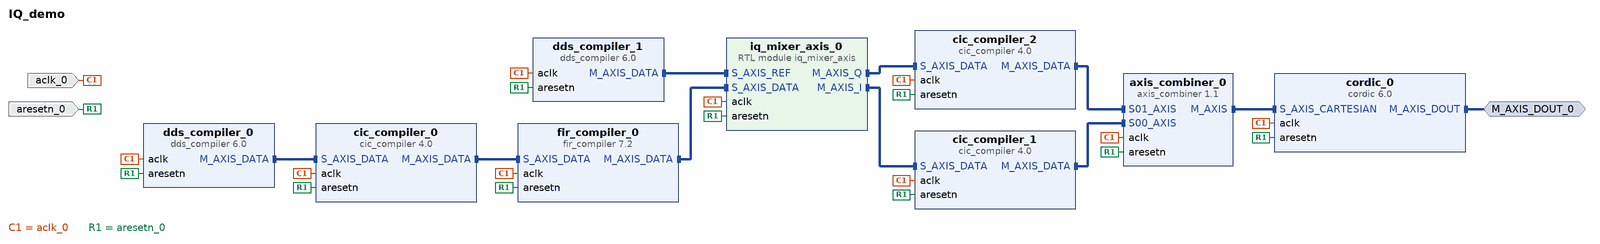
[diagram p0: block diagram of the top level]
# Vivado block design IQ_demo, xc7z010clg400-1, Vivado 2021.2
create_bd_design IQ_demo

create_bd_intf_port -mode Master -vlnv xilinx.com:interface:axis_rtl:1.0 M_AXIS_DOUT_0
set_property -dict {CONFIG.FREQ_HZ 125000000} [get_bd_intf_ports M_AXIS_DOUT_0]
create_bd_port -dir I -type clk aclk_0
set_property -dict {CONFIG.FREQ_HZ 125000000} [get_bd_ports aclk_0]
create_bd_port -dir I -type rst aresetn_0

create_bd_cell -type ip -vlnv xilinx.com:ip:dds_compiler:6.0 dds_compiler_0
set_property -dict [list \
  CONFIG.DATA_Has_TLAST Not_Required \
  CONFIG.DDS_Clock_Rate 125 \
  CONFIG.Frequency_Resolution 0.4 \
  CONFIG.Has_ARESETn true \
  CONFIG.Has_Phase_Out false \
  CONFIG.Latency 9 \
  CONFIG.M_DATA_Has_TUSER Not_Required \
  CONFIG.Noise_Shaping Auto \
  CONFIG.Output_Frequency1 0.1 \
  CONFIG.Output_Selection Sine \
  CONFIG.Output_Width 14 \
  CONFIG.PINC1 1101000110110111000 \
  CONFIG.POFF1 1000000000000000000000000000 \
  CONFIG.Phase_Offset_Angles1 0.25 \
  CONFIG.Phase_Width 29 \
  CONFIG.Phase_offset Fixed \
  CONFIG.S_PHASE_Has_TUSER Not_Required \
  CONFIG.Spurious_Free_Dynamic_Range 84 \
] [get_bd_cells dds_compiler_0]
create_bd_cell -type ip -vlnv xilinx.com:ip:cic_compiler:4.0 cic_compiler_0
set_property -dict [list \
  CONFIG.Clock_Frequency 125 \
  CONFIG.Filter_Type Decimation \
  CONFIG.Fixed_Or_Initial_Rate 8 \
  CONFIG.HAS_ARESETN true \
  CONFIG.Input_Data_Width 14 \
  CONFIG.Input_Sample_Frequency 125 \
  CONFIG.Maximum_Rate 8 \
  CONFIG.Minimum_Rate 8 \
  CONFIG.Number_Of_Stages 6 \
  CONFIG.Output_Data_Width 16 \
  CONFIG.Quantization Truncation \
  CONFIG.SamplePeriod 1 \
] [get_bd_cells cic_compiler_0]
create_bd_cell -type ip -vlnv xilinx.com:ip:fir_compiler:7.2 fir_compiler_0
set_property -dict [list \
  CONFIG.BestPrecision true \
  CONFIG.Clock_Frequency 125 \
  CONFIG.CoefficientSource COE_File \
  CONFIG.Coefficient_File ../../../../../../rx_fir.coe \
  CONFIG.Coefficient_Fractional_Bits 24 \
  CONFIG.Coefficient_Sets 1 \
  CONFIG.Coefficient_Sign Signed \
  CONFIG.Coefficient_Structure Inferred \
  CONFIG.Coefficient_Width 24 \
  CONFIG.ColumnConfig 3 \
  CONFIG.Decimation_Rate 2 \
  CONFIG.Filter_Architecture Systolic_Multiply_Accumulate \
  CONFIG.Filter_Type Decimation \
  CONFIG.Has_ARESETn true \
  CONFIG.Interpolation_Rate 1 \
  CONFIG.Number_Channels 1 \
  CONFIG.Output_Rounding_Mode Convergent_Rounding_to_Even \
  CONFIG.Output_Width 18 \
  CONFIG.Quantization Quantize_Only \
  CONFIG.RateSpecification Frequency_Specification \
  CONFIG.Sample_Frequency 15.625 \
  CONFIG.Zero_Pack_Factor 1 \
] [get_bd_cells fir_compiler_0]
create_bd_cell -type ip -vlnv xilinx.com:ip:cic_compiler:4.0 cic_compiler_1
set_property -dict [list \
  CONFIG.Clock_Frequency 125 \
  CONFIG.Filter_Type Decimation \
  CONFIG.Fixed_Or_Initial_Rate 625 \
  CONFIG.HAS_ARESETN true \
  CONFIG.Input_Data_Width 17 \
  CONFIG.Input_Sample_Frequency 7.8125 \
  CONFIG.Maximum_Rate 625 \
  CONFIG.Minimum_Rate 625 \
  CONFIG.Output_Data_Width 24 \
  CONFIG.Quantization Truncation \
  CONFIG.SamplePeriod 1 \
] [get_bd_cells cic_compiler_1]
create_bd_cell -type ip -vlnv xilinx.com:ip:cordic:6.0 cordic_0
set_property -dict [list \
  CONFIG.ARESETN true \
  CONFIG.Compensation_Scaling Embedded_Multiplier \
  CONFIG.Data_Format SignedFraction \
  CONFIG.Functional_Selection Translate \
  CONFIG.Input_Width 24 \
  CONFIG.Output_Width 24 \
  CONFIG.Phase_Format Scaled_Radians \
] [get_bd_cells cordic_0]
create_bd_cell -type module -reference iq_mixer_axis iq_mixer_axis_0
create_bd_cell -type ip -vlnv xilinx.com:ip:dds_compiler:6.0 dds_compiler_1
set_property -dict [list \
  CONFIG.DDS_Clock_Rate 125 \
  CONFIG.Frequency_Resolution 0.4 \
  CONFIG.Has_ARESETn true \
  CONFIG.Has_Phase_Out false \
  CONFIG.Latency 8 \
  CONFIG.M_DATA_Has_TUSER Not_Required \
  CONFIG.Noise_Shaping Auto \
  CONFIG.Output_Frequency1 0.1 \
  CONFIG.Output_Width 16 \
  CONFIG.PINC1 1101000110110111000 \
  CONFIG.Phase_Width 29 \
  CONFIG.Spurious_Free_Dynamic_Range 96 \
] [get_bd_cells dds_compiler_1]
create_bd_cell -type ip -vlnv xilinx.com:ip:cic_compiler:4.0 cic_compiler_2
set_property -dict [list \
  CONFIG.Clock_Frequency 125 \
  CONFIG.Filter_Type Decimation \
  CONFIG.Fixed_Or_Initial_Rate 625 \
  CONFIG.HAS_ARESETN true \
  CONFIG.Input_Data_Width 17 \
  CONFIG.Input_Sample_Frequency 7.8125 \
  CONFIG.Maximum_Rate 625 \
  CONFIG.Minimum_Rate 625 \
  CONFIG.Output_Data_Width 24 \
  CONFIG.Quantization Truncation \
  CONFIG.SamplePeriod 1 \
] [get_bd_cells cic_compiler_2]
create_bd_cell -type ip -vlnv xilinx.com:ip:axis_combiner:1.1 axis_combiner_0
set_property -dict {CONFIG.TDATA_NUM_BYTES 3} [get_bd_cells axis_combiner_0]

# ---- connections ----

connect_bd_intf_net [get_bd_intf_pins axis_combiner_0/M_AXIS] [get_bd_intf_pins cordic_0/S_AXIS_CARTESIAN]
connect_bd_intf_net [get_bd_intf_pins cic_compiler_0/M_AXIS_DATA] [get_bd_intf_pins fir_compiler_0/S_AXIS_DATA]
connect_bd_intf_net [get_bd_intf_pins cic_compiler_1/M_AXIS_DATA] [get_bd_intf_pins axis_combiner_0/S00_AXIS]
connect_bd_intf_net [get_bd_intf_pins cic_compiler_2/M_AXIS_DATA] [get_bd_intf_pins axis_combiner_0/S01_AXIS]
connect_bd_intf_net [get_bd_intf_ports M_AXIS_DOUT_0] [get_bd_intf_pins cordic_0/M_AXIS_DOUT]
connect_bd_intf_net [get_bd_intf_pins dds_compiler_0/M_AXIS_DATA] [get_bd_intf_pins cic_compiler_0/S_AXIS_DATA]
connect_bd_intf_net [get_bd_intf_pins dds_compiler_1/M_AXIS_DATA] [get_bd_intf_pins iq_mixer_axis_0/S_AXIS_REF]
connect_bd_intf_net [get_bd_intf_pins iq_mixer_axis_0/S_AXIS_DATA] [get_bd_intf_pins fir_compiler_0/M_AXIS_DATA]
connect_bd_intf_net [get_bd_intf_pins iq_mixer_axis_0/M_AXIS_I] [get_bd_intf_pins cic_compiler_1/S_AXIS_DATA]
connect_bd_intf_net [get_bd_intf_pins iq_mixer_axis_0/M_AXIS_Q] [get_bd_intf_pins cic_compiler_2/S_AXIS_DATA]
connect_bd_net -net aclk_0_1 [get_bd_ports aclk_0] \
  [get_bd_pins dds_compiler_0/aclk] [get_bd_pins cic_compiler_0/aclk] [get_bd_pins fir_compiler_0/aclk] \
  [get_bd_pins cic_compiler_1/aclk] [get_bd_pins cordic_0/aclk] [get_bd_pins dds_compiler_1/aclk] \
  [get_bd_pins iq_mixer_axis_0/aclk] [get_bd_pins cic_compiler_2/aclk] [get_bd_pins axis_combiner_0/aclk]
connect_bd_net -net aresetn_0_1 [get_bd_ports aresetn_0] \
  [get_bd_pins dds_compiler_0/aresetn] [get_bd_pins cic_compiler_0/aresetn] [get_bd_pins fir_compiler_0/aresetn] \
  [get_bd_pins cic_compiler_1/aresetn] [get_bd_pins cordic_0/aresetn] [get_bd_pins iq_mixer_axis_0/aresetn] \
  [get_bd_pins dds_compiler_1/aresetn] [get_bd_pins cic_compiler_2/aresetn] [get_bd_pins axis_combiner_0/aresetn]

validate_bd_design
save_bd_design
